# Altium schematic sheet Motor_Driver_Sheet.SchDoc
size 420 x 297 mm; SheetNumber: 6; SheetTotal: 9
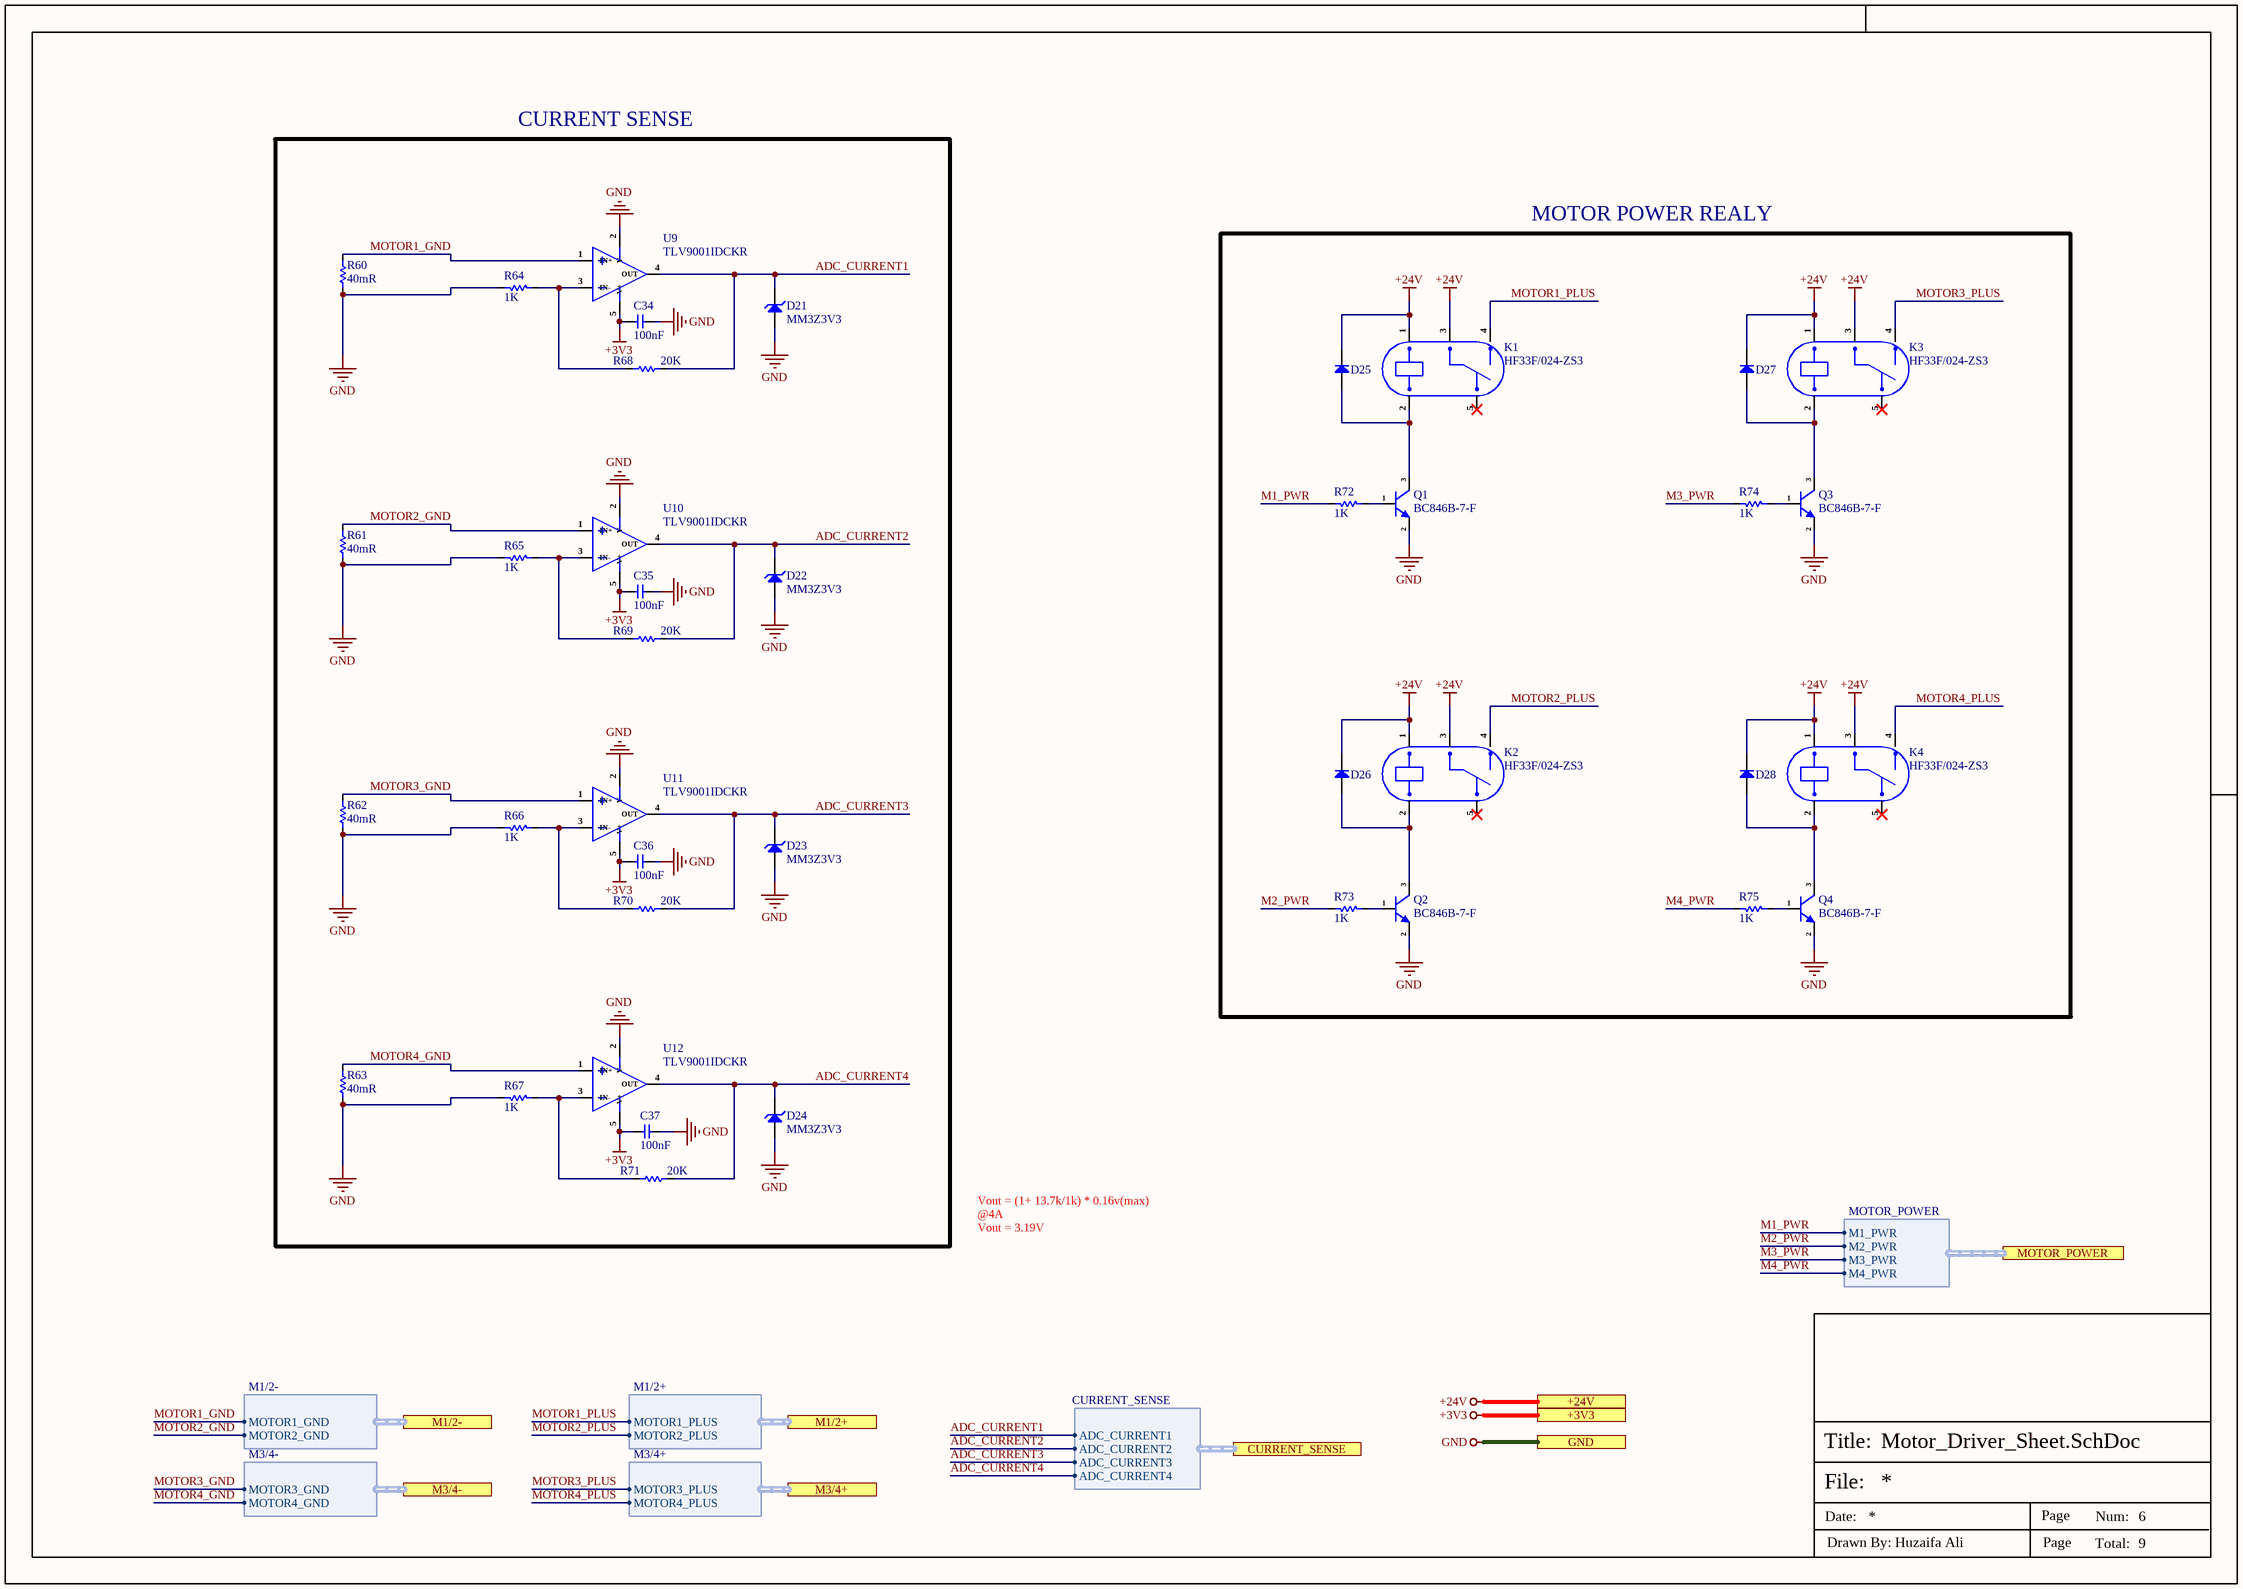
[diagram p0: Motor_Driver_Sheet.SchDoc]

## Parts
C34  100nF  [cap-0402]
C35  100nF  [cap-0402]
C36  100nF  [cap-0402]
C37  100nF  [cap-0402]
D21  MM3Z3V3  [SOD-323]
D22  MM3Z3V3  [SOD-323]
D23  MM3Z3V3  [SOD-323]
D24  MM3Z3V3  [SOD-323]
D25  1N4148WS-7-F  [SOD-323]  (value not drawn)
D26  1N4148WS-7-F  [SOD-323]  (value not drawn)
D27  1N4148WS-7-F  [SOD-323]  (value not drawn)
D28  1N4148WS-7-F  [SOD-323]  (value not drawn)
K1  HF33F/024-ZS3  [HF33F/024-ZS3]
K2  HF33F/024-ZS3  [HF33F/024-ZS3]
K3  HF33F/024-ZS3  [HF33F/024-ZS3]
K4  HF33F/024-ZS3  [HF33F/024-ZS3]
Q1  BC846B-7-F  [SOT-23]
Q2  BC846B-7-F  [SOT-23]
Q3  BC846B-7-F  [SOT-23]
Q4  BC846B-7-F  [SOT-23]
R60  40mR  [Res-1206]
R61  40mR  [Res-1206]
R62  40mR  [Res-1206]
R63  40mR  [Res-1206]
R64  1K  [Res-0402]
R65  1K  [Res-0402]
R66  1K  [Res-0402]
R67  1K  [Res-0402]
R68  20K  [Res-0402]
R69  20K  [Res-0402]
R70  20K  [Res-0402]
R71  20K  [Res-0402]
R72  1K  [Res-0402]
R73  1K  [Res-0402]
R74  1K  [Res-0402]
R75  1K  [Res-0402]
U9  TLV9001IDCKR  [SC-70-5]
U10  TLV9001IDCKR  [SC-70-5]
U11  TLV9001IDCKR  [SC-70-5]
U12  TLV9001IDCKR  [SC-70-5]

## Ports
+3V3 (see Top_Sheet[2C], CAN_Sheet[5D], Connector_Sheet1[5D], Connector_Sheet2[3D], Controller_Sheet[2D], EtherCAT_Sheet[5D], Power_Sheet[5D], RS485_RS232_Sheet[5D]), +24V (see Top_Sheet[2B], Power_Sheet[5D]), CURRENT_SENSE (harness CURRENT_SENSE, see Top_Sheet[2C], Controller_Sheet[5D]), GND (see Top_Sheet[2C], CAN_Sheet[5D], Connector_Sheet1[5D], Connector_Sheet2[3D], Controller_Sheet[2D], EtherCAT_Sheet[5D], Power_Sheet[5D], RS485_RS232_Sheet[5D]), M1/2+ (harness M1/2+, see Top_Sheet[2B], Connector_Sheet1[5D]), M1/2- (harness M1/2-, see Top_Sheet[2C], Connector_Sheet1[5D]), M3/4+ (harness M3/4+, see Top_Sheet[2C], Connector_Sheet2[5D]), M3/4- (harness M3/4-, see Top_Sheet[2C], Connector_Sheet2[5D]), MOTOR_POWER (harness MOTOR_POWER, see Top_Sheet[2C], Controller_Sheet[5D])

## Harnesses
M1/2+: MOTOR1_PLUS, MOTOR2_PLUS
M3/4+: MOTOR3_PLUS, MOTOR4_PLUS
M1/2-: MOTOR1_GND, MOTOR2_GND
M3/4-: MOTOR3_GND, MOTOR4_GND
CURRENT_SENSE: ADC_CURRENT1, ADC_CURRENT2, ADC_CURRENT3, ADC_CURRENT4
MOTOR_POWER: M1_PWR, M2_PWR, M3_PWR, M4_PWR

## Nets
+3V3: C34.2 C35.2 C36.2 C37.2 U9.5(V+) U10.5(V+) U11.5(V+) U12.5(V+) ; port +3V3
+24V: D25.1(K) D26.1(K) D27.1(K) D28.1(K) K1.1 K1.3 K2.1 K2.3 K3.1 K3.3 K4.1 K4.3 ; port +24V
GND: C34.1 C35.1 C36.1 C37.1 D21.2(A) D22.2(A) D23.2(A) D24.2(A) Q1.2(E) Q2.2(E) Q3.2(E) Q4.2(E) R60.1 R61.1 R62.1 R63.1 R64.2 R65.2 R66.2 R67.2 U9.2(V-) U10.2(V-) U11.2(V-) U12.2(V-) ; port GND
ADC_CURRENT1: D21.1(K) R68.2 U9.4(OUT) ; port CURRENT_SENSE.ADC_CURRENT1
ADC_CURRENT2: D22.1(K) R69.2 U10.4(OUT) ; port CURRENT_SENSE.ADC_CURRENT2
ADC_CURRENT3: D23.1(K) R70.2 U11.4(OUT) ; port CURRENT_SENSE.ADC_CURRENT3
ADC_CURRENT4: D24.1(K) R71.2 U12.4(OUT) ; port CURRENT_SENSE.ADC_CURRENT4
M1_PWR: R72.2 ; port MOTOR_POWER.M1_PWR
M2_PWR: R73.2 ; port MOTOR_POWER.M2_PWR
M3_PWR: R74.2 ; port MOTOR_POWER.M3_PWR
M4_PWR: R75.2 ; port MOTOR_POWER.M4_PWR
MOTOR1_GND: R60.2 U9.1(IN+) ; port M1/2-.MOTOR1_GND
MOTOR1_PLUS: K1.4 ; port M1/2+.MOTOR1_PLUS
MOTOR2_GND: R61.2 U10.1(IN+) ; port M1/2-.MOTOR2_GND
MOTOR2_PLUS: K2.4 ; port M1/2+.MOTOR2_PLUS
MOTOR3_GND: R62.2 U11.1(IN+) ; port M3/4-.MOTOR3_GND
MOTOR3_PLUS: K3.4 ; port M3/4+.MOTOR3_PLUS
MOTOR4_GND: R63.2 U12.1(IN+) ; port M3/4-.MOTOR4_GND
MOTOR4_PLUS: K4.4 ; port M3/4+.MOTOR4_PLUS
NetD25_2: D25.2(A) K1.2 Q1.3(C)
NetD26_2: D26.2(A) K2.2 Q2.3(C)
NetD27_2: D27.2(A) K3.2 Q3.3(C)
NetD28_2: D28.2(A) K4.2 Q4.3(C)
NetQ1_1: Q1.1(B) R72.1
NetQ2_1: Q2.1(B) R73.1
NetQ3_1: Q3.1(B) R74.1
NetQ4_1: Q4.1(B) R75.1
NetR64_1: R64.1 R68.1 U9.3(IN-)
NetR65_1: R65.1 R69.1 U10.3(IN-)
NetR66_1: R66.1 R70.1 U11.3(IN-)
NetR67_1: R67.1 R71.1 U12.3(IN-)

Not connected (* = marked no-connect by the designer): K1 5*; K2 5*; K3 5*; K4 5*

## Notes on the sheet
- CURRENT SENSE
- MOTOR POWER REALY
- Vout = (1+ 13.7k/1k) * 0.16v(max) @4A
  Vout = 3.19V
- File:
- Title:
- Date:
- Page
- Num:
- Total:
- Drawn By: Huzaifa Ali

## Library data of the parts
C34-C37 = C1005X7R1H104KT000F: CAP CER 0.1UF 50V X7R 0402; Manufacturer: TDK; Tolerance: 10%; Voltage: 25V; Item Type: Capacitor; Supplier 1: Avnet; Manufacturer Part Number: C1005X7R1H104KT000F; RoHS: No; Category: Ceramic Capacitors; Dielectric: X7R; Supplier Part Number 1: C1005X7R1H104KT000F; LCSC Part Number: C361198; ComponentLink1Description: LCSC; ComponentLink1URL: https://www.lcsc.com/product-detail/Multilayer-Ceramic-Capacitors-MLCC-SMD-SMT_TDK-C1005X7R1H104KT000F_C361198.html
D21-D24 = MM3Z3V3: ±5% Single 3.1V~3.5V 300mW 3.3V SOD-323 Zener Diodes ROHS; Manufacturer: JSMSEMI; Item Type: Diode; ComponentLink1Description: LCSC; ComponentLink1URL: https://www.lcsc.com/product-detail/Zener-Diodes_Shandong-Jingdao-Microelectronics-MM3Z3V3_C123917.html; Manufacturer Part Number: MM3Z3V3; Package: SOD-323; LCSC Part Number: C123917
D25-D28 = 1N4148WS-7-F: DIODE GEN PURP 75V 150MA SOD323; Manufacturer: Diodes; Forward Current: 300mA; Reverse Recovery Time: 4ns; Element Configuration: Single; Forward Voltage: 1.25V; Max Reverse Current: 1uA; Peak Non-Repetitive Surge Current: 2A; Power Dissipation: 200mW; Polarity: Standard; Capacitance: 2pF; Supplier 1: Mouser; Manufacturer Part Number: 1N4148WS-7-F; RoHS: Yes; Category: Rectifier Diodes; Pricing 1: 1=0.19000, 10=0.17500, 50=0.17500, 100=0.09600, 500=0.05900, 1000=0.04000, 3000=0.03000, 9000=0.02600, 10000=0.02600, 24000=0.02300, 45000=0.01900 (USD); Mount: Surface Mount; Number of Pins: 2; Weight: 0.000173oz; Contact Plating: Tin,Matte; Min Operating Temperature: -65°C; Max Operating Temperature: 150°C; Max Repetitive Reverse Voltage (Vrrm): 75V; Max Forward Surge Current (Ifsm): 2A; Max Surge Current: 2A; Packaging: Tape and Reel; Recovery Time: 4ns; Package Quantity: 3000; Average Rectified Current: 150mA; Voltage Rating (DC): 75V; Power Rating: 200mW; Current Rating: 150mA; Output Current: 150mA; Voltage: 75V; Max Reverse Voltage (DC): 75V; Series: -; Reverse Recovery Time-Max: 4ns; Length: 1.8mm; Width: 1.4mm; Height: 1mm; Radiation Hardening: No; REACH SVHC: No SVHC; Lead Free: Lead Free; RoHS Compliant: Yes; ComponentLink1URL: https://datasheet.ciiva.com/1179/ds30097-1179355.pdf?src-supplier=Element14; ComponentLink1Description: https://datasheet.ciiva.com/1179/ds30097-1179355.pdf?src-supplier=Element14; ComponentLink2URL: https://datasheet.ciiva.com/8300/ds30097-8300396.pdf?src-supplier=Avnet; ComponentLink2Description: https://datasheet.ciiva.com/8300/ds30097-8300396.pdf?src-supplier=Avnet; ComponentLink3URL: https://datasheet.ciiva.com/16199/ds30097-16199061.pdf?src-supplier=Future+Electronics; ComponentLink3Description: https://datasheet.ciiva.com/16199/ds30097-16199061.pdf?src-supplier=Future+Electronics; ComponentLink4URL: https://datasheet.ciiva.com/911/ds30097-911742.pdf?src-supplier=Digi-Key; ComponentLink4Description: https://datasheet.ciiva.com/911/ds30097-911742.pdf?src-supplier=Digi-Key; ComponentLink5URL: https://datasheet.ciiva.com/911/ds30097-911743.pdf?src-supplier=Digi-Key; ComponentLink5Description: https://datasheet.ciiva.com/911/ds30097-911743.pdf?src-supplier=Digi-Key; ComponentLink6URL: https://datasheet.ciiva.com/911/ds30097-911741.pdf?src-supplier=Digi-Key; ComponentLink6Description: https://datasheet.ciiva.com/911/ds30097-911741.pdf?src-supplier=Digi-Key; Supplier Part Number 1: 621-1N4148WS-F; LCSC Part Number: C60580; Item Type: Diode
K1-K4 = HF33F/024-ZS3: 24V 10A SPDT (1 Form C) Plugin,10.2x20.5mm Power Relays ROHS; Manufacturer: HF(Xiamen Hongfa Electroacoustic); Item Type: Relay; Manufacturer Part Number: HF33F/024-ZS3; Package: Plugin,10.2x20.5mm; LCSC Part Number: C36391; ComponentLink1Description: LCSC; ComponentLink1URL: https://www.lcsc.com/product-detail/Power-Relays_HF-Xiamen-Hongfa-Electroacoustic-HF33F-024-ZS3_C36391.html
Q1-Q4 = BC846B-7-F: TRANS NPN 65V 0.1A SOT23-3; Manufacturer: Diodes; Item Type: Transistors; Supplier: Future Electronics; Supplier Part Number: 3888237; Manufacturer Part Number: BC846B-7-F; RoHS: Yes; Category: BJTs; Stock: 4416000; Pricing: 3000=0.0363, 12000=0.0348, 45000=0.0335, 120000=0.0325, 300000=0.0309 (USD); ComponentLink1URL: https://datasheet.ciiva.com/15139/getdatasheetpartid-139519-15139459.pdf?src-supplier=Verical; ComponentLink1Description: https://datasheet.ciiva.com/15139/getdatasheetpartid-139519-15139459.pdf?src-supplier=Verical; ComponentLink2URL: https://datasheet.ciiva.com/22711/1911717-22711685.pdf?src-supplier=Element14; ComponentLink2Description: https://datasheet.ciiva.com/22711/1911717-22711685.pdf?src-supplier=Element14; LCSC Part Number: C183643
R60-R63 = LR1206-21R040F4: 1W 40mΩ Surface Mount Current Sensing Resistors ±50ppm/℃ ±1% 1206 Current Sense Resistors/Shunt Resistors ROHS; Manufacturer: RALEC; Manufacturer Part Number: LR1206-21R040F4; Package: 1206; LCSC Part Number: C2681030; Item Type: Resistor; ComponentLink1Description: LCSC; ComponentLink1URL: https://www.lcsc.com/product-detail/Current-Sense-Resistors-Shunt-Resistors_RALEC-LR1206-21R040F4_C2681030.html
R64-R67 R72-R75 = CRCW04021K00FKEDHP: RES SMD 1K OHM 1% 1/5W 0402; Manufacturer: Vishay Dale; Resistance: 1kR; Temperature Coefficient: 100ppm/°C; Power Rating: 125mW; Voltage Rating: 50V; Supplier 1: Digi-Key; Manufacturer Part Number: CRCW04021K00FKEDHP; Stock 1: 315989; Pricing 1: 1=0.15, 10=0.132, 100=0.0506, 1000=0.02226, 2500=0.01923, 5000=0.0172 (USD); Mount: Surface Mount; Case/Package: 0402; Number of Pins: 2; Contact Plating: Tin; Weight: 2.3E-05oz; Case Code (Imperial): 0402; Case Code (Metric): 1005; Size Code: 0402; Min Operating Temperature: -55°C; Max Operating Temperature: 155°C; Tolerance: 1%; Resistor Type: Thick Film; Package Quantity: 10; Packaging: Tape and Reel; Number of Terminations: 2; Termination: SMD/SMT; Max Power Dissipation: 125mW; Voltage Rating (DC): 50V; Features: Automotive AEC-Q200; Series: CRCW-HP; Construction: Rectangular; Technology: THICK FILM; Resistance Tolerance: 1%; Length: 1mm; Width: 0.5mm; Height: 0.3mm; Depth: 0.5mm; Radiation Hardening: No; REACH SVHC: Unknown; Military Standard: Not; Lead Free: Lead Free; RoHS Compliant: Yes; ComponentLink1URL: http://www.farnell.com/datasheets/2339608.pdf?src-supplier=Element14; ComponentLink1Description: http://www.farnell.com/datasheets/2339608.pdf?src-supplier=Element14; ComponentLink2URL: http://www.vishay.com/docs/20043/crcwhpe3.pdf?src-supplier=Digi-Key; ComponentLink2Description: http://www.vishay.com/docs/20043/crcwhpe3.pdf?src-supplier=Digi-Key; ComponentLink3URL: http://www.mouser.com/ds/2/427/crcwhpe3-46056.pdf?src-supplier=Mouser; ComponentLink3Description: http://www.mouser.com/ds/2/427/crcwhpe3-46056.pdf?src-supplier=Mouser; ComponentLink4URL: http://www.vishay.com/docs/20043/crcwhpe3.pdf?src-supplier=Avnet; ComponentLink4Description: http://www.vishay.com/docs/20043/crcwhpe3.pdf?src-supplier=Avnet; ComponentLink5URL: http://www.vishay.com/docs/20043/crcwhpe3.pdf?src-supplier=Future+Electronics; ComponentLink5Description: http://www.vishay.com/docs/20043/crcwhpe3.pdf?src-supplier=Future+Electronics; Supplier Part Number 1: 541-1.00KYCT-ND; LCSC Part Number: C313354
R68-R71 = RC0402FR-0720KL: RES 20K OHM 1% 1/16W 0402; Manufacturer: Yageo; Resistance: 20kR; Power Rating: 62.5mW; Voltage Rating: 50V; Temperature Coefficient: 100ppm/°C; Max Power Dissipation: 63mW; Item Type: Resistor; Supplier 1: Avnet; Manufacturer Part Number: RC0402FR-0720KL; RoHS: Yes; Category: Chip SMD Resistors; Stock 1: 1960708; Pricing 1: 10000=0.00085 (USD); Case/Package: 0402; Number of Pins: 2; Case Code (Metric): 1005; Case Code (Imperial): 0402; Size Code: 0402; Min Operating Temperature: -55°C; Max Operating Temperature: 155°C; Tolerance: 1%; Package Quantity: 1; Packaging: Tape and Reel; Resistor Type: Thick Film; Number of Terminations: 2; Termination: SMD/SMT; Voltage Rating (DC): 50V; Features: Moisture Resistant; Series: RC; Technology: THICK FILM; Resistance Tolerance: 1%; Construction: Rectangular; Length: 1mm; Width: 0.02inch; Height: 0.016inch; Depth: 0.5mm; RoHS Compliant: Yes; Reach SVHC Compliant: Yes; Military Standard: Not; Lead Free: Lead Free; ComponentLink1URL: https://datasheet.ciiva.com/11808/0900766b80c66297-11808454.pdf?src-supplier=RSComponents; ComponentLink1Description: https://datasheet.ciiva.com/11808/0900766b80c66297-11808454.pdf?src-supplier=RSComponents; ComponentLink2URL: https://datasheet.ciiva.com/7983/1018594-7983511.pdf?src-supplier=Element14; ComponentLink2Description: https://datasheet.ciiva.com/7983/1018594-7983511.pdf?src-supplier=Element14; ComponentLink3URL: https://datasheet.ciiva.com/46394/1018594-46394974.pdf?src-supplier=Element14; ComponentLink3Description: https://datasheet.ciiva.com/46394/1018594-46394974.pdf?src-supplier=Element14; ComponentLink4URL: https://datasheet.ciiva.com/2453/pyu-r-int-thick-7-2453494.pdf?src-supplier=Digi-Key; ComponentLink4Description: https://datasheet.ciiva.com/2453/pyu-r-int-thick-7-2453494.pdf?src-supplier=Digi-Key; ComponentLink5URL: https://datasheet.ciiva.com/2453/pyu-r-int-thick-7-2453495.pdf?src-supplier=Digi-Key; ComponentLink5Description: https://datasheet.ciiva.com/2453/pyu-r-int-thick-7-2453495.pdf?src-supplier=Digi-Key; ComponentLink6URL: https://datasheet.ciiva.com/2453/pyu-r-int-thick-7-2453493.pdf?src-supplier=Digi-Key; ComponentLink6Description: https://datasheet.ciiva.com/2453/pyu-r-int-thick-7-2453493.pdf?src-supplier=Digi-Key; ComponentLink7URL: https://datasheet.ciiva.com/12558/pyu-rc0402-51-rohs-l-6-r-8721-12558796.pdf?src-supplier=Mouser; ComponentLink7Description: https://datasheet.ciiva.com/12558/pyu-rc0402-51-rohs-l-6-r-8721-12558796.pdf?src-supplier=Mouser; Supplier Part Number 1: RC0402FR-0720KL; LCSC Part Number: C93942
U9-U12 = TLV9001IDCKR: IC CMOS 1 CIRCUIT SC70-5; Manufacturer: Texas Instruments; Number of Channels: 1; Slew Rate: 2V/µs; Gain Bandwidth Product: 1MHz; Input Bias Current: 5pA; Input Offset Voltage (Vos): 400uV; Operating Supply Current: 60uA; Output Current per Channel: 40mA; Supplier: Mouser; Supplier Part Number: 595-TLV9001IDCKR; Manufacturer Part Number: TLV9001IDCKR; RoHS: Yes; Item Type: IC; Stock: 13115; Pricing: 1=0.47, 10=0.348, 50=0.348, 100=0.194, 1000=0.146, 10000=0.117 (USD); Mounting Technology: Surface Mount; Min Operating Temperature: -40°C; Max Operating Temperature: 125°C; Packaging: Cut Tape; Number of Circuits: 1; Series: -; RoHS Compliant: Yes; ComponentLink1URL: http://www.ti.com/lit/ds/symlink/tlv9001.pdf?src-supplier=Digikey; ComponentLink1Description: http://www.ti.com/lit/ds/symlink/tlv9001.pdf?src-supplier=Digikey; LCSC Part Number: C398362